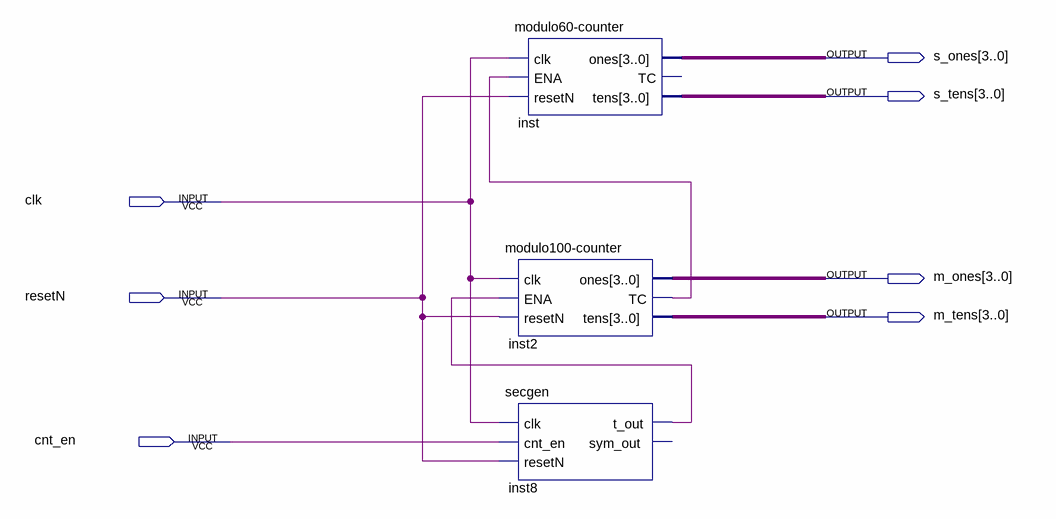
[diagram p0: schematic sheet]
// Quartus schematic stopper.bdf as structural Verilog: 3 symbols, 7 pins
module stopper (
  input  clk,
  input  resetN,
  input  cnt_en,
  output [3:0] s_ones,
  output [3:0] s_tens,
  output [3:0] m_ones,
  output [3:0] m_tens
);

  wire inst2_tc, inst8_t_out;

  \modulo60-counter  inst (.clk(clk), .ENA(inst2_tc), .resetN(resetN), .ones(s_ones), .tens(s_tens));  // open: TC
  \modulo100-counter  inst2 (
    .clk(clk), .ENA(inst8_t_out), .resetN(resetN), .ones(m_ones), .TC(inst2_tc), .tens(m_tens));
  secgen inst8 (.clk(clk), .cnt_en(cnt_en), .resetN(resetN), .t_out(inst8_t_out));  // open: sym_out
endmodule
